# EAGLE design lagmeter-complete (EAGLE 8.0.2)
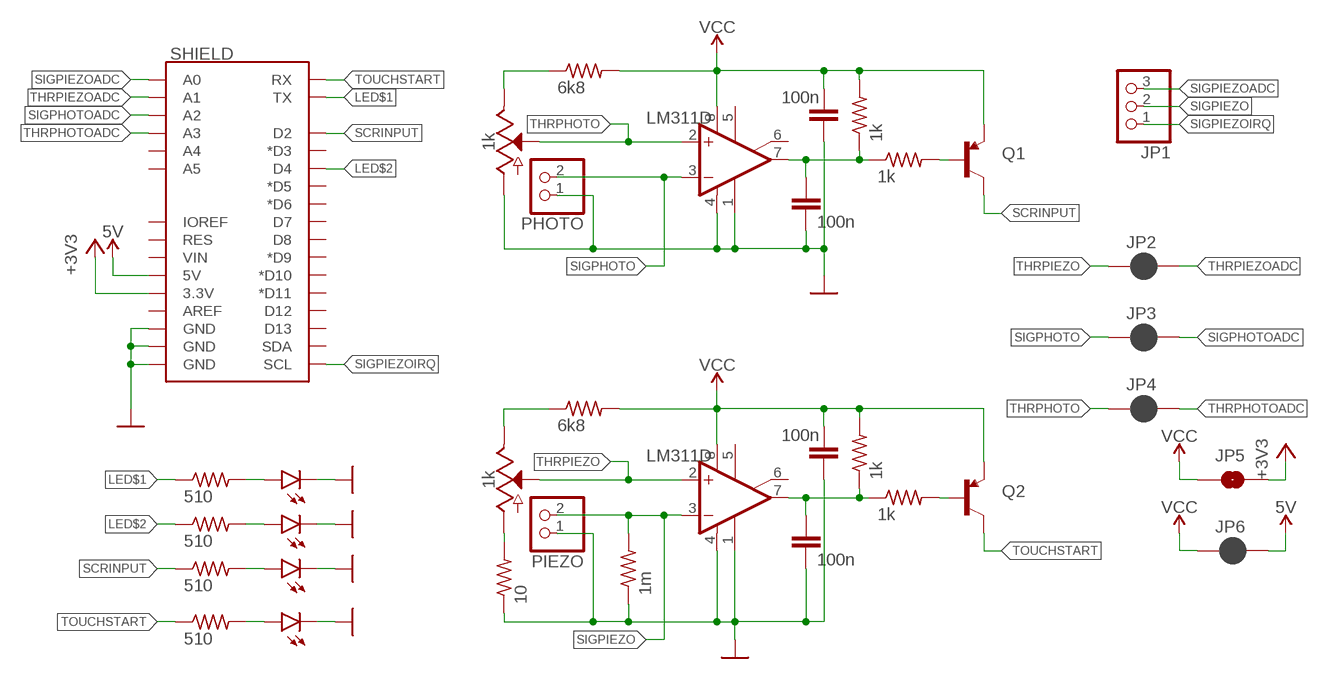
[diagram p0: schematic, sheet 1]

## Parts
C1  100n  C-EUC0805  [C0805]
C2  100n  C-EUC0805  [C0805]
C3  100n  C-EUC0805  [C0805]
C4  100n  C-EUC0805  [C0805]
D1  LED1206  [LED-1206]
D2  LED1206  [LED-1206]
D3  LED1206  [LED-1206]
D4  LED1206  [LED-1206]
IC1  LM311D  [SO08]
IC2  LM311D  [SO08]
JP1  PINHD-1X3  [1X03]
JP2  JUMPER-SMT_2_NC_PASTE_SILK  [SMT-JUMPER_2_NC_PASTE_SILK]
JP3  JUMPER-SMT_2_NC_PASTE_SILK  [SMT-JUMPER_2_NC_PASTE_SILK]
JP4  JUMPER-SMT_2_NC_PASTE_SILK  [SMT-JUMPER_2_NC_PASTE_SILK]
JP5  JUMPER-SMT_2_NO_NO-SILK  [SMT-JUMPER_2_NO_NO-SILK]
JP6  JUMPER-SMT_2_NC_PASTE_NO-SILK  [SMT-JUMPER_2_NC_PASTE_NO-SILK]
PHOTO  PINHD-1X2  [1X02]
PIEZO  PINHD-1X2  [1X02]
Q1  TRANSISTOR_PNPSMD  [SOT23-3]
Q2  TRANSISTOR_PNPSMD  [SOT23-3]
R1  6k8  R-US_R0603  [R0603]
R2  6k8  R-US_R0603  [R0603]
R3  1k  R-US_R0603  [R0603]
R4  1k  R-US_R0603  [R0603]
R5  1k  R-US_R0603  [R0603]
R6  1k  R-US_R0603  [R0603]
R7  510  R-US_R0603  [R0603]
R8  510  R-US_R0603  [R0603]
R9  510  R-US_R0603  [R0603]
R10  510  R-US_R0603  [R0603]
R11  1m  R-US_R0603  [R0603]
R12  10  R-US_R0603  [R0603]
SHIELD  ARDUINO_UNO_R3_SHIELDBASIC  [UNO_R3_SHIELD]
VR1  1k  POTENTIOMETER-PTH-9MM-1/20W-20%  [POT-PTH-ALPS]
VR2  1k  POTENTIOMETER-PTH-9MM-1/20W-20%  [POT-PTH-ALPS]

## Nets
5V: JP6.2 SHIELD.5V
+3V3: JP5.2 SHIELD.3.3V
GND: C1.2 C2.2 C3.2 C4.2 D1.C D2.C D3.C D4.C IC1.1(GND) IC1.4(V-) IC2.1(GND) IC2.4(V-) PHOTO.1 PIEZO.1 R11.1 R12.1 SHIELD.GND@0(GND) SHIELD.GND@1(GND) SHIELD.GND@2(GND) VR1.P$3(A)
LED$1: R9.1 SHIELD.TX
LED$2: R7.1 SHIELD.D4
MAXTHR: R2.1 VR2.P$1(E)
MINTHR: R12.2 VR2.P$3(A)
N$1: D1.A R9.2
N$2: C2.1 IC1.7(OUT) R3.1 R4.1
N$3: D2.A R7.2
N$4: D3.A R8.2
N$6: Q1.1(B) R3.2
N$9: C4.1 IC2.7(OUT) R5.1 R6.1
N$11: Q2.1(B) R5.2
N$14: D4.A R10.2
REFPHOTO: R1.1 VR1.P$1(E)
SCRINPUT: Q1.3(C) R8.1 SHIELD.D2
SIGPHOTO: IC1.3(-IN) JP3.1 PHOTO.2
SIGPHOTOADC: JP3.2 SHIELD.A2
SIGPIEZO: IC2.3(-IN) JP1.2 PIEZO.2 R11.2
SIGPIEZOADC: JP1.3 SHIELD.A0
SIGPIEZOIRQ: JP1.1 SHIELD.SCL
THRPHOTO: IC1.2(+IN) JP4.1 VR1.P$2(S)
THRPHOTOADC: JP4.2 SHIELD.A3
THRPIEZO: IC2.2(+IN) JP2.1 VR2.P$2(S)
THRPIEZOADC: JP2.2 SHIELD.A1
TOUCHSTART: Q2.3(C) R10.1 SHIELD.RX
VCC: C1.1 C3.1 IC1.8(V+) IC2.8(V+) JP5.1 JP6.1 Q1.2(E) Q2.2(E) R1.2 R2.2 R4.2 R6.2
Unconnected: IC1.5(ON) IC1.6(ON/STR) IC2.5(ON) IC2.6(ON/STR) SHIELD.A4 SHIELD.A5 SHIELD.AREF SHIELD.D3(*D3) SHIELD.D5(*D5) SHIELD.D6(*D6) SHIELD.D7 SHIELD.D8 SHIELD.D9(*D9) SHIELD.D10(*D10) SHIELD.D11(*D11) SHIELD.D12 SHIELD.D13 SHIELD.IOREF SHIELD.RES SHIELD.SDA SHIELD.VIN

## Library data of the parts
C1-C4 = rcl:C-EU: CAPACITOR, European symbol
D1-D4 = SparkFun-LED:LED: LED (Generic) Standard schematic elements and footprints for 5mm, 3mm, 1206, and 0603 sized LEDs. Generic LEDs with no color specified.
IC1 IC2 = linear:LM311: COMPARATOR
JP1 = pinhead:PINHD-1X3: PIN HEADER
JP2-JP4 JP6 = SparkFun-Jumpers:JUMPER-SMT_2_NC_PASTE: Normally closed solder jumper This jumper has an aperture in the stencil to allow solder paste to bridge the split in the wire so it's normally closed (NC). Wick off the solder to open the connection. Reapply solder to reclose the connection.
JP5 = SparkFun-Jumpers:JUMPER-SMT_2_NO: Normally open jumper This jumper has two pads in close proximity to each other. Apply solder to close the connection. Round pads are easier to solder for beginners, but are a lot larger. SparkFun Product that uses the round pads: SparkFun EL Sequencer <https://www.sparkfun.com/products/12781>
PHOTO PIEZO = pinhead:PINHD-1X2: PIN HEADER
Q1 Q2 = User-Submitted:TRANSISTOR_PNP: Generic PNP BJT Double check pinouts against datasheets- not all devices are the same! MMBT3906 - 40V 200mA SOT-23 (TRANS-08052) MMBT4403 - 40V 600mA SOT-23 (TRANS-09245)
R1-R12 = rcl:R-US_: RESISTOR, American symbol
SHIELD = SparkFun-Boards:ARDUINO_UNO_R3_SHIELD: Arduino R3 Shield Footprint Shield form compatible with the Arduino Uno R3. SparkFun Products: MG2639 Cellular Shield <https://www.sparkfun.com/products/13120> MIDI Shield <https://www.sparkfun.com/products/12898> R3 Stackable Headers Kit <https://www.sparkfun.com/products/11417>
VR1 VR2 = SparkFun-Resistors:POTENTIOMETER: Potentiometer (Pot) Three-terminal potentiometers, with an adjustable wiper and two adjustable resistors. A pot can be used to create a configurable voltage divider, or as a variable resistor. Variants ALPS_POT and ALPS_POT_KIT - PTH, breadboard compatible, 9mm square pots Rotary Potentiometer - Linear (10k ohm) <https://www.sparkfun.com/products/9288> (COM-09288) The KIT variant exposes copper on only one side of the PTH pad, so the part can only be assembled on one side of the PCB. Useful for beginner soldering kits.; PROD_ID: RES-09177; SF_SKU: COM-09288; VALUE: 10k

## Board
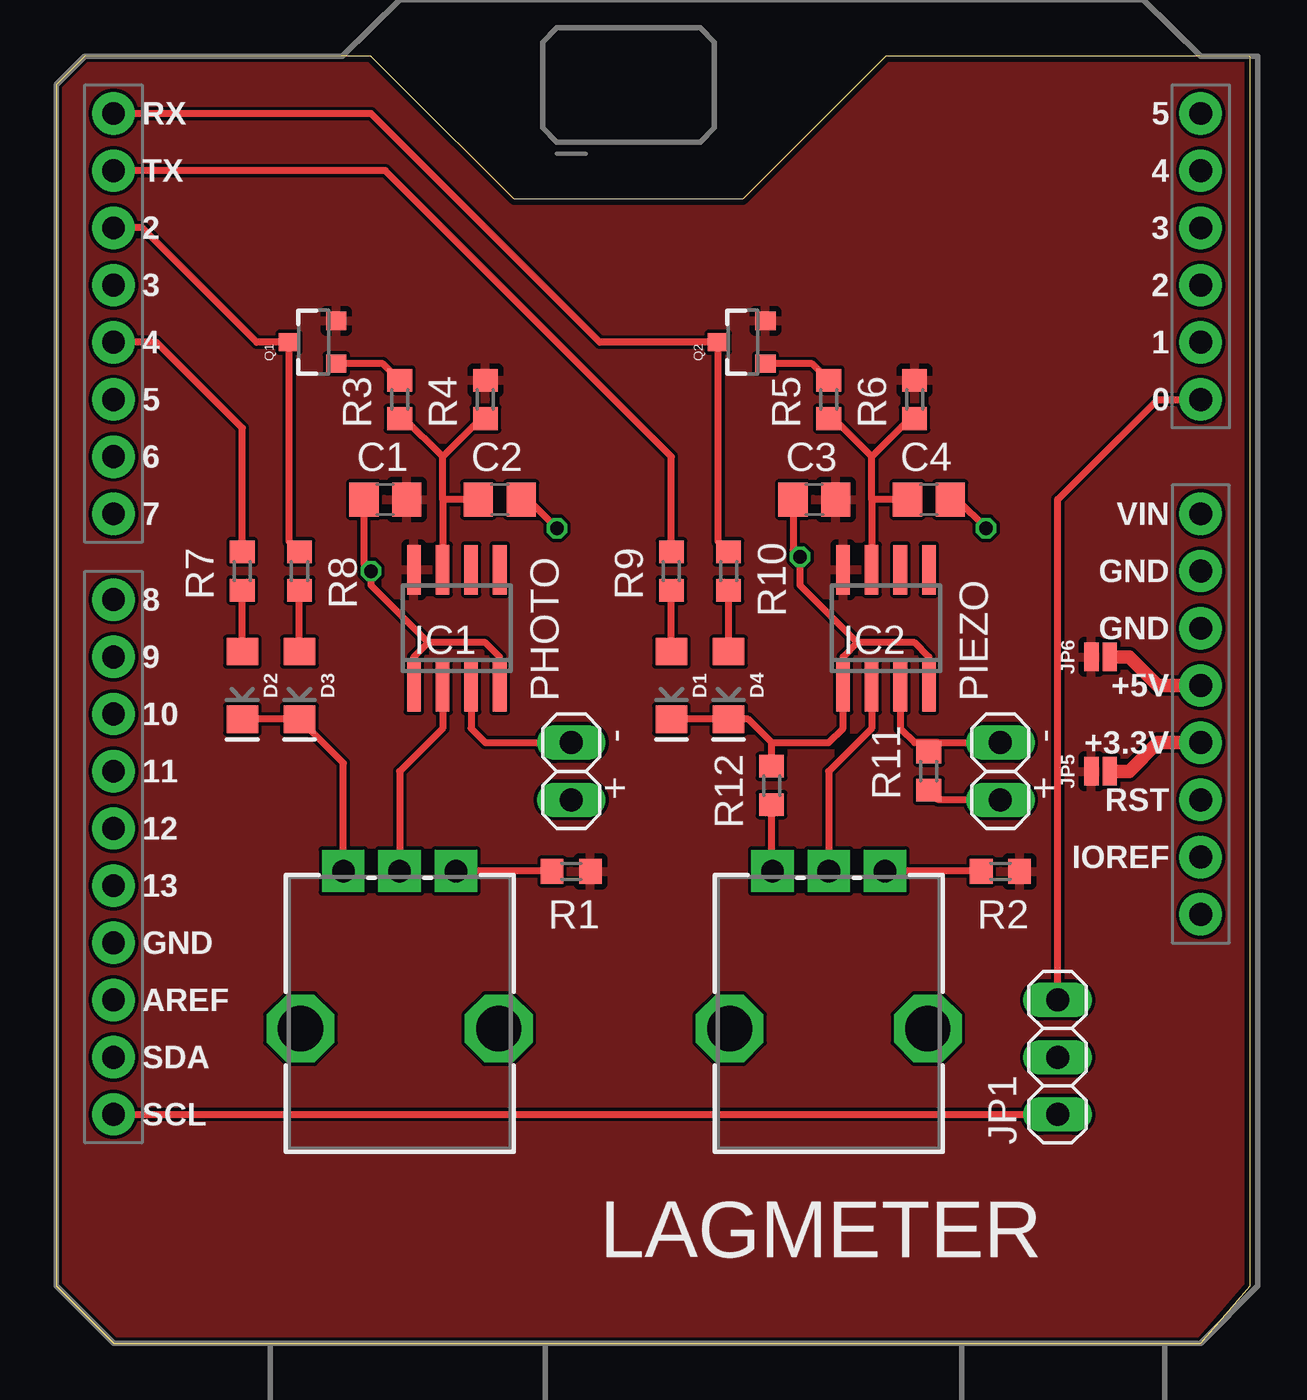
[diagram p1: board, top side]
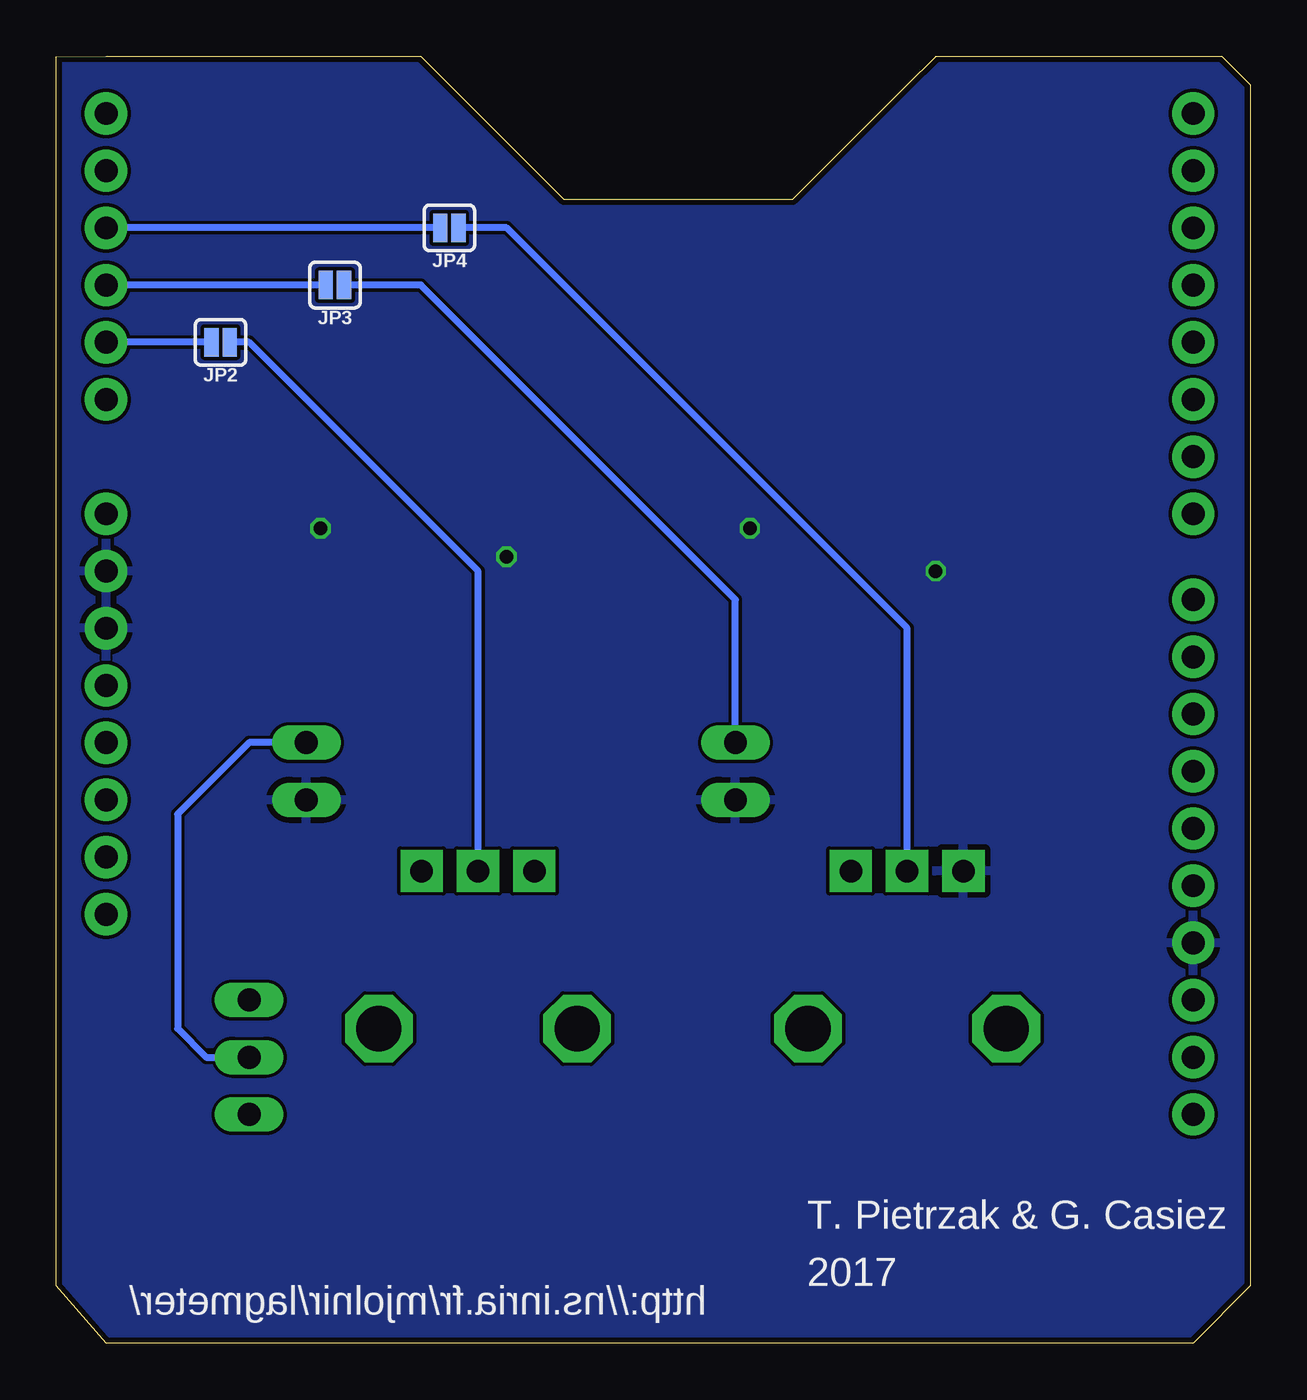
[diagram p2: board, bottom side, seen from below]

Size 53.01 x 57.15 mm. Coordinates in mm from the lower left corner, seen from the top.
Outline: 0,2.54 2.54,0 50.8,0 53.01,2.54 53.01,57.14 50.8,57.15 36.83,57.15 30.48,50.8 20.32,50.8 15.25,55.87 13.97,57.14 13.97,57.15 1.27,57.15 0,55.88 0,2.54
Copper layers (1*16): Top 0.035mm / dielectric 1.5mm / Bottom 0.035mm
Design rules "ITEADstudio_DRC": minimum track width 6mil, minimum drill 12mil, track to track 6mil, track to pad 6mil, pad to pad 6mil, via to via 6mil, smd to smd 0mil, copper to edge 10mil, drill to drill 10mil, minimum pad ring 10mil, minimum via ring 6mil, stop-mask expansion 2mil, vias tented up to drill 100mil, thermal gap 10mil

### Footprints (pad centres in the part's own frame; a part is rotated, then mirrored left to right if it is on the bottom)
C0805 = smd 1.3 x 1.5: 1 -0.95,0; 2 0.95,0
LED-1206 = smd 1.2 x 1.4: A -1.5,0; C 1.5,0
SO08 = smd 0.6 x 2.2: 1 -1.905,-2.6; 2 -0.635,-2.6; 3 0.635,-2.6; 4 1.905,-2.6; 5 1.905,2.6; 6 0.635,2.6; 7 -0.635,2.6; 8 -1.905,2.6
1X03 = drill 1.016 long: 1 -2.54,0; 2 0,0; 3 2.54,0
SMT-JUMPER_2_NC_PASTE_SILK = smd 0.635 x 1.27: 1 -0.406,0; 2 0.406,0
SMT-JUMPER_2_NO_NO-SILK = smd 0.635 x 1.27: 1 -0.406,0; 2 0.406,0
SMT-JUMPER_2_NC_PASTE_NO-SILK = smd 0.635 x 1.27: 1 -0.406,0; 2 0.406,0
1X02 = drill 1.016 long: 1 -1.27,0; 2 1.27,0
SOT23-3 = smd 0.8 x 0.9: 1 -0.95,-1; 2 0.95,-1; 3 0,1.1
R0603 = smd 1 x 1.1: 1 -0.85,0; 2 0.85,0
UNO_R3_SHIELD = drill 1.016 pad 1.88: 3.3V 24.13,-2.54; 5V 24.13,0; A0 24.13,12.7; A1 24.13,15.24; A2 24.13,17.78; A3 24.13,20.32; A4 24.13,22.86; A5 24.13,25.4; AREF -24.13,-13.97; D2 -24.13,20.32; D3 -24.13,17.78; D4 -24.13,15.24; D5 -24.13,12.7; D6 -24.13,10.16; D7 -24.13,7.62; D8 -24.13,3.81; D9 -24.13,1.27; D10 -24.13,-1.27; D11 -24.13,-3.81; D12 -24.13,-6.35; D13 -24.13,-8.89; GND@0 24.13,2.54; GND@1 24.13,5.08; GND@2 -24.13,-11.43; IOREF 24.13,-7.62; NC 24.13,-10.16; RES 24.13,-5.08; RX -24.13,25.4; SCL -24.13,-19.05; SDA -24.13,-16.51; TX -24.13,22.86; VIN 24.13,7.62
POT-PTH-ALPS = drill 1 pad 1.88 square: P$1 7,-2.5; P$2 7,0; P$3 7,2.5 | drill 2 octagon: P$4 0,-4.4; P$5 0,4.4

### Placement (x,y rotation side)
C1  14.61,37.47 180 top
C2  19.68,37.47 0 top
C3  33.66,37.47 180 top
C4  38.73,37.47 0 top
D1  27.3,29.21 270 top
D2  8.26,29.21 270 top
D3  10.79,29.21 270 top
D4  29.84,29.21 270 top
IC1  17.78,31.75 0 top
IC2  36.83,31.75 0 top
JP1  44.45,12.7 90 top
JP2  45.72,44.45 180 bottom
JP3  40.64,46.99 180 bottom
JP4  35.56,49.53 180 bottom
JP5  46.35,25.4 0 top
JP6  46.35,30.48 0 top
PHOTO  22.86,25.4 90 top
PIEZO  41.91,25.4 90 top
Q1  11.43,44.45 90 top
Q2  30.48,44.45 90 top
R1  22.86,20.95 0 top
R2  41.91,20.95 0 top
R3  15.24,41.91 90 top
R4  19.05,41.91 90 top
R5  34.29,41.91 90 top
R6  38.1,41.91 90 top
R7  8.26,34.29 270 top
R8  10.79,34.29 270 top
R9  27.3,34.29 270 top
R10  29.84,34.29 270 top
R11  38.73,25.4 90 top
R12  31.75,24.77 270 top
SHIELD  26.67,29.21 0 top
VR1  15.24,13.97 90 top
VR2  34.29,13.97 90 top

### Tracks (layer width: path | path; a pad name or v marks a point on that pad's centre or on a via)
5V
  Top 0.61: JP6.2 47.62,30.48 48.9,29.21 SHIELD.5V
+3V3
  Top 0.61: JP5.2 47.62,25.4 48.9,26.67 SHIELD.3.3V
GND  (via drill 0.6)
  Top 0.305: D2.C D3.C 12.74,25.77 VR1.P$3 | D1.C D4.C 30.71,27.71 31.75,26.67 | 35.56,31.11 34.92,30.48 IC2.1 34.92,27.3 34.29,26.67 31.75,26.67 | IC2.4 38.73,30.48 38.1,31.11 35.56,31.11 | IC1.4 19.68,30.48 19.05,31.11 16.51,31.11 | IC1.1 15.88,30.48 16.51,31.11 | PIEZO.1 39.16,24.13 R11.1 | C1.2 13.65,34.6 v13.97,34.29 13.97,33.66 16.51,31.11 | C2.2 20.95,37.47 v22.23,36.2 | C3.2 32.7,35.24 v33.02,34.92 33.02,33.66 35.56,31.11 | C4.2 40.01,37.47 v41.27,36.2 | R12.1 31.75,26.67
  pour Bottom: 0,55.88 0,2.54 2.54,0 50.8,0 53.34,2.54 53.34,57.15 36.83,57.15 30.48,50.8 20.32,50.8 13.97,57.15 1.27,57.15
LED$1
  Top 0.305: SHIELD.TX 14.61,52.07 27.3,39.37 R9.1
LED$2
  Top 0.305: R7.1 8.26,40.64 4.45,44.45 SHIELD.D4
MAXTHR
  Top 0.305: R2.1 41.05,20.97 VR2.P$1
MINTHR
  Top 0.305: VR2.P$3 31.75,21.01 R12.2
N$1
  Top 0.305: D1.A R9.2
N$2
  Top 0.305: 17.14,37.47 IC1.7 | 17.14,37.47 17.14,39.37 | 17.14,39.37 15.46,41.06 R3.1 | 17.14,39.37 18.84,41.06 R4.1 | C2.1 17.14,37.47
N$3
  Top 0.305: D2.A R7.2
N$4
  Top 0.305: D3.A R8.2
N$6
  Top 0.305: R3.2 14.5,43.5 Q1.1
N$9
  Top 0.305: 36.2,37.47 IC2.7 | 36.2,37.47 36.2,39.37 | 36.2,39.37 34.51,41.06 R5.1 | 36.2,39.37 37.88,41.06 R6.1 | C4.1 36.2,37.47
N$11
  Top 0.305: R5.2 33.55,43.5 Q2.1
N$14
  Top 0.305: D4.A R10.2
REFPHOTO
  Top 0.305: R1.1 22,20.97 VR1.P$1
SCRINPUT
  Top 0.305: SHIELD.D2 3.81,49.53 8.89,44.45 Q1.3 10.33,35.6 R8.1 10.96,35.31
SIGPHOTO
  Top 0.305: IC1.3 18.41,27.3 19.05,26.67 PHOTO.2
  Bottom 0.305: PHOTO.2 22.86,33.02 36.83,46.99 JP3.1
SIGPHOTOADC
  Bottom 0.305: JP3.2 SHIELD.A2
SIGPIEZO
  Top 0.305: IC2.3 37.47,27.3 38.1,26.67 39.16,26.67 | 39.16,26.67 PIEZO.2 | R11.2 39.16,26.67
  Bottom 0.305: PIEZO.2 44.45,26.67 47.62,23.5 47.62,13.97 46.35,12.7 JP1.2
SIGPIEZOADC
  Top 0.305: JP1.3 44.45,37.47 48.9,41.91 SHIELD.A0
SIGPIEZOIRQ
  Top 0.305: SHIELD.SCL JP1.1
THRPHOTO
  Top 0.305: IC1.2 17.14,27.3 15.24,25.4 VR1.P$2
  Bottom 0.305: VR1.P$2 15.24,31.75 33.02,49.53 JP4.1
THRPHOTOADC
  Bottom 0.305: JP4.2 SHIELD.A3
THRPIEZO
  Top 0.305: IC2.2 36.2,27.3 34.29,25.4 VR2.P$2
  Bottom 0.305: VR2.P$2 34.29,34.29 44.45,44.45 JP2.1
THRPIEZOADC
  Bottom 0.305: JP2.2 SHIELD.A1
TOUCHSTART
  Top 0.305: SHIELD.RX 13.97,54.61 24.13,44.45 Q2.3 29.38,35.6 R10.1
VCC
  pour Top: 0,55.88 0,2.54 2.54,0 50.8,0 53.34,2.54 53.34,57.15 36.83,57.15 30.48,50.8 20.32,50.8 13.97,57.15 1.27,57.15

### Text on the board
tNames: - | - | + | + | LAGMETER
bNames: T. Pietrzak & G. Casiez | 2017 | http://ns.inria.fr/mjolnir/lagmeter/